# Altium schematic sheet XT90PW(2+2)-M.G.Y_2026-10-20.schdoc
size 46 x 37 mm
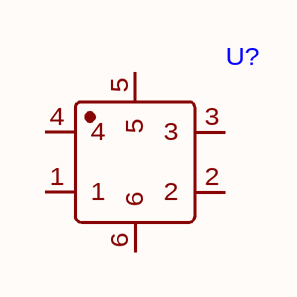
[diagram p0: XT90PW(2+2)-M.G.Y_2026-10-20.schdoc]

## Parts
U?  (no value)  [CONN-TH_XT90PW2X2-MGY]

## Nets

Not connected (* = marked no-connect by the designer): U? 1 2 3 4 5 6

## Library data of the parts
U? = XT90PW(2+2)-M.G.Y